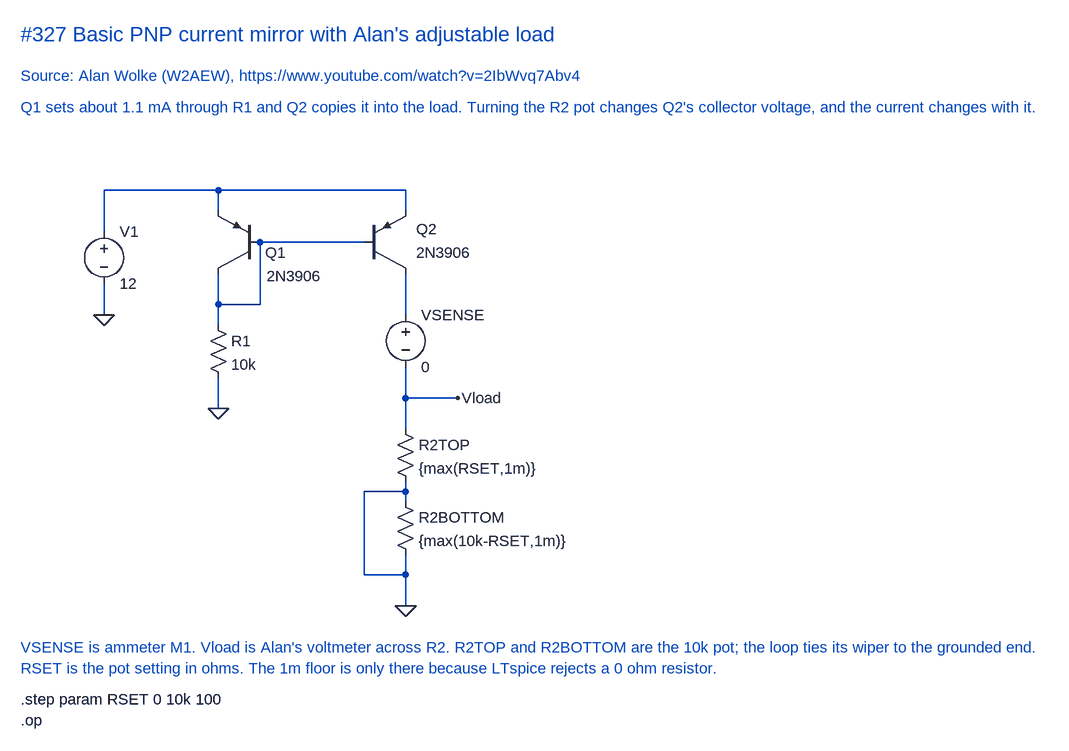
[diagram p0: schematic Basic current mirror.asc]
Basic current mirror.asc, the LTspice schematic file:
Version 4.1
SHEET 1 1744 1120
WIRE 336 272 160 272
WIRE 624 272 336 272
WIRE 336 304 336 272
WIRE 624 304 624 272
WIRE 160 336 160 272
WIRE 560 352 400 352
WIRE 336 448 336 400
WIRE 400 448 400 352
WIRE 400 448 336 448
WIRE 160 464 160 416
WIRE 624 464 624 400
WIRE 336 480 336 448
WIRE 624 592 624 544
WIRE 704 592 624 592
WIRE 336 608 336 560
WIRE 624 640 624 592
WIRE 624 736 624 720
WIRE 624 736 560 736
WIRE 624 752 624 736
WIRE 560 864 560 736
WIRE 624 864 624 832
WIRE 624 864 560 864
WIRE 624 912 624 864
FLAG 160 464 0
FLAG 336 608 0
FLAG 624 912 0
FLAG 704 592 Vload
SYMBOL voltage 160 320 R0
SYMATTR InstName V1
SYMATTR Value 12
SYMBOL pnp 400 400 R180
WINDOW 0 -40 32 Left 2
WINDOW 3 -95 -4 Left 2
SYMATTR InstName Q1
SYMATTR Value 2N3906
SYMBOL pnp 560 400 M180
WINDOW 0 80 68 Left 2
WINDOW 3 80 32 Left 2
SYMATTR InstName Q2
SYMATTR Value 2N3906
SYMBOL res 320 464 R0
SYMATTR InstName R1
SYMATTR Value 10k
SYMBOL voltage 624 448 R0
SYMATTR InstName VSENSE
SYMATTR Value 0
SYMBOL res 608 624 R0
SYMATTR InstName R2TOP
SYMATTR Value {max(RSET,1m)}
SYMBOL res 608 736 R0
SYMATTR InstName R2BOTTOM
SYMATTR Value {max(10k-RSET,1m)}
TEXT 32 32 Left 3 ;#327 Basic PNP current mirror with Alan's adjustable load
TEXT 32 96 Left 2 ;Source: Alan Wolke (W2AEW), https://www.youtube.com/watch?v=2IbWvq7Abv4
TEXT 32 144 Left 2 ;Q1 sets about 1.1 mA through R1 and Q2 copies it into the load. Turning the R2 pot changes Q2's collector voltage, and the current changes with it.
TEXT 32 976 Left 2 ;VSENSE is ammeter M1. Vload is Alan's voltmeter across R2. R2TOP and R2BOTTOM are the 10k pot; the loop ties its wiper to the grounded end.
TEXT 32 1008 Left 2 ;RSET is the pot setting in ohms. The 1m floor is only there because LTspice rejects a 0 ohm resistor.
TEXT 32 1056 Left 2 !.step param RSET 0 10k 100
TEXT 32 1088 Left 2 !.op

The netlist it stands for:
* Basic current mirror.asc
V1 N001 0 12
Q1 N002 N002 N001 0 2N3906
Q2 N003 N002 N001 0 2N3906
R1 N002 0 10k
VSENSE N003 Vload 0
R2TOP Vload 0 {max(RSET,1m)}
R2BOTTOM 0 0 {max(10k-RSET,1m)}
.model NPN NPN
.model PNP PNP
.lib standard.bjt
* #327 Basic PNP current mirror with Alan's adjustable load
* Source: Alan Wolke (W2AEW), https://www.youtube.com/watch?v=2IbWvq7Abv4
* Q1 sets about 1.1 mA through R1 and Q2 copies it into the load. Turning the R2 pot changes Q2's collector voltage, and the current changes with it.
* VSENSE is ammeter M1. Vload is Alan's voltmeter across R2. R2TOP and R2BOTTOM are the 10k pot; the loop ties its wiper to the grounded end.
* RSET is the pot setting in ohms. The 1m floor is only there because LTspice rejects a 0 ohm resistor.
.step param RSET 0 10k 100
.op
.backanno
.end